# Altium project RK3566_.PrjPcb (part 6 of 6)
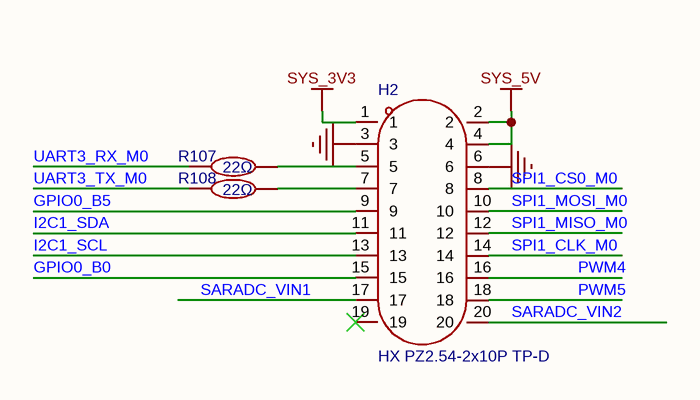
[diagram p13: 引出引脚_螺纹孔.schdoc]

## Nets that join several sheets
AVSS1_1: HDMI PHY _ IO1 (31 pins), LPDDR4X PHY_IO (119 pins), PMUIO _ VCCIO (24 pins), SD卡 PHY (8 pins), USB接口 PHY_IO (49 pins), WIFI_BT PHY (21 pins), 板载电源 (271 pins), 串口 PHY (D34.1 D35.1 H1.4), 扬声器_麦克风 (C191.2 C194.1 C195.1 R89.1), 以太网 PHY_以太网_WIFIBT IO (24 pins), 引出引脚_螺纹孔 (H2.3 H2.6)
LDO1: HDMI PHY _ IO1 (C3.1 C4.1 U1.1N13 U1.1N14), 板载电源 (C180.1 U8.23)
LDO2: PMUIO _ VCCIO (C76.2 C77.2 U1.1H5), USB接口 PHY_IO (6 pins), 板载电源 (C181.1 U8.21)
LDO3: PMUIO _ VCCIO (6 pins), 板载电源 (C182.1 U8.20)
LDO4: PMUIO _ VCCIO (C70.2 U1.1D13), 板载电源 (C183.1 U8.28), 扬声器_麦克风 (R88.2)
LDO5: PMUIO _ VCCIO (C71.2 U1.1F17), 板载电源 (C184.1 U8.29)
LDO6: PMUIO _ VCCIO (7 pins), 板载电源 (C185.1 R69.2 U8.31)
LDO7: PMUIO _ VCCIO (C82.2 C83.2 U1.1H4), USB接口 PHY_IO (6 pins), 板载电源 (C186.1 U8.3), 以太网 PHY_以太网_WIFIBT IO (C196.2 R90.1 U1.1D15 U1.1D16)
LDO8: LPDDR4X PHY_IO (16 pins), 板载电源 (C187.1 U8.5)
LDO9: HDMI PHY _ IO1 (C1.1 C2.1 U1.1P13), 板载电源 (C189.1 U8.6)
SWOUT1: HDMI PHY _ IO1 (Q2.1 Q3.1 R7.1 R9.1), USB接口 PHY_IO (C90.1 C99.1 U1.1H18 U1.1J2), WIFI_BT PHY (C118.2 C119.2 U6.22), 板载电源 (C188.1 R57.2 U8.55), 以太网 PHY_以太网_WIFIBT IO (11 pins)
SWOUT2: SD卡 PHY (CARD1.4), 板载电源 (C190.1 U8.58)
SYS0_5V: USB接口 PHY_IO (C101.2 R48.2 U4.7), 板载电源 (C134.2 C135.2 L5.1 R63.2)
SYS_3V3: HDMI PHY _ IO1 (R4.2), WIFI_BT PHY (C112.2 C113.2 U6.9), 板载电源 (19 pins), 串口 PHY (H1.1), 引出引脚_螺纹孔 (H2.1)
SYS_5V: HDMI PHY _ IO1 (D14.2 Q1.2), USB接口 PHY_IO (8 pins), 板载电源 (17 pins), 扬声器_麦克风 (C195.2 L15.2), 引出引脚_螺纹孔 (H2.2 H2.4)
VBUCK3: LPDDR4X PHY_IO (68 pins), 板载电源 (7 pins)
VCC_1V8: PMUIO _ VCCIO (C67.2 C73.2 U1.1C13 U1.1E16), 板载电源 (5 pins)
VDDQ: LPDDR4X PHY_IO (44 pins), 板载电源 (5 pins)
BT_HOST_WAKE: PMUIO _ VCCIO (U1.1B16 U1.1R16), WIFI_BT PHY (U6.7)
BT_REG_ON: PMUIO _ VCCIO (U1.1A17), WIFI_BT PHY (U6.34)
BT_WAKE: PMUIO _ VCCIO (U1.1A16), WIFI_BT PHY (U6.6)
CLK32K: WIFI_BT PHY (U6.24), 板载电源 (R57.1 R58.2)
GPIO0_B0: PMUIO _ VCCIO (U1.1T20), 引出引脚_螺纹孔 (H2.15)
GPIO0_B5: PMUIO _ VCCIO (U1.1U20), 引出引脚_螺纹孔 (H2.9)
HDMITX_CEC_M0: HDMI PHY _ IO1 (Q1.1 R4.1), 以太网 PHY_以太网_WIFIBT IO (U1.1V5)
HDMITX_SCL: HDMI PHY _ IO1 (Q2.2 R7.2), 以太网 PHY_以太网_WIFIBT IO (U1.AR12)
HDMITX_SDA: HDMI PHY _ IO1 (Q3.2 R9.2), 以太网 PHY_以太网_WIFIBT IO (U1.AP11)
I2C0_SCL: PMUIO _ VCCIO (U1.AJ37), 板载电源 (U8.1)
I2C0_SDA: PMUIO _ VCCIO (U1.AK38), 板载电源 (U8.2)
I2C1_SCL: PMUIO _ VCCIO (R23.2 U1.AK37), 引出引脚_螺纹孔 (H2.13)
I2C1_SDA: PMUIO _ VCCIO (R25.2 U1.AM38), 引出引脚_螺纹孔 (H2.11)
I2S1_LRCK_TX_M0: PMUIO _ VCCIO (R15.1), 板载电源 (U8.14)
I2S1_MCLK_M0: PMUIO _ VCCIO (R13.1), 板载电源 (U8.16)
I2S1_SCLK_TX_M0: PMUIO _ VCCIO (R14.1), 板载电源 (U8.15)
I2S1_SDI0_M0: PMUIO _ VCCIO (U1.1B14), 板载电源 (U8.18)
I2S1_SDO0_M0: PMUIO _ VCCIO (U1.B25), 板载电源 (U8.17)
MICIN: 板载电源 (U8.42), 扬声器_麦克风 (C193.1)
MICIP: 板载电源 (U8.43), 扬声器_麦克风 (C192.1)
PDM_CLK0_M0: PMUIO _ VCCIO (R16.1), 板载电源 (U8.19)
PMIC_INT: PMUIO _ VCCIO (U1.1R19), 板载电源 (U8.7)
PMIC_SLEEP: PMUIO _ VCCIO (U1.1P19), 板载电源 (U8.49)
PWM4: PMUIO _ VCCIO (U1.AN38), 引出引脚_螺纹孔 (H2.16)
PWM5: PMUIO _ VCCIO (U1.AM37), 引出引脚_螺纹孔 (H2.18)
RESETN: PMUIO _ VCCIO (C69.2 U1.1R20 U1.AG38), 板载电源 (5 pins)
SARADC_VIN1: 以太网 PHY_以太网_WIFIBT IO (U1.1C17), 引出引脚_螺纹孔 (H2.17)
SARADC_VIN2: 以太网 PHY_以太网_WIFIBT IO (U1.1B18), 引出引脚_螺纹孔 (H2.20)
SDMMC0_CLK: PMUIO _ VCCIO (R22.2), SD卡 PHY (CARD1.5 D18.2)
SDMMC0_CMD: PMUIO _ VCCIO (U1.1E19), SD卡 PHY (R30.1)
SDMMC0_D0: PMUIO _ VCCIO (U1.1E20), SD卡 PHY (R31.1)
SDMMC0_D1: PMUIO _ VCCIO (U1.1F19), SD卡 PHY (R32.1)
SDMMC0_D2: PMUIO _ VCCIO (U1.1D20), SD卡 PHY (R28.1)
SDMMC0_D3: PMUIO _ VCCIO (U1.1F18), SD卡 PHY (R29.1)
SDMMC0_DET: PMUIO _ VCCIO (U1.AF37), SD卡 PHY (R33.1)
SDMMC1_CLK: PMUIO _ VCCIO (R21.2), WIFI_BT PHY (U6.17)
SDMMC1_CMD: PMUIO _ VCCIO (U1.B35), WIFI_BT PHY (R53.1)
SDMMC1_D0: PMUIO _ VCCIO (U1.1C19), WIFI_BT PHY (R54.1)
SDMMC1_D1: PMUIO _ VCCIO (U1.1E18), WIFI_BT PHY (R55.1)
SDMMC1_D2: PMUIO _ VCCIO (U1.1D18), WIFI_BT PHY (R51.1)
SDMMC1_D3: PMUIO _ VCCIO (U1.1A20), WIFI_BT PHY (R52.1)
SPI1_CLK_M0: PMUIO _ VCCIO (R20.2), 引出引脚_螺纹孔 (H2.14)
SPI1_CS0_M0: PMUIO _ VCCIO (R17.2), 引出引脚_螺纹孔 (H2.8)
SPI1_MISO_M0: PMUIO _ VCCIO (R19.2), 引出引脚_螺纹孔 (H2.12)
SPI1_MOSI_M0: PMUIO _ VCCIO (R18.2), 引出引脚_螺纹孔 (H2.10)
SPKN_OUT: 板载电源 (U8.34), 扬声器_麦克风 (L14.1)
SPKP_OUT: 板载电源 (U8.32), 扬声器_麦克风 (L13.1)
UART0_RX: PMUIO _ VCCIO (U1.1T19), 串口 PHY (R86.1)
UART0_TX: PMUIO _ VCCIO (U1.1R18), 串口 PHY (R87.1)
UART1_CTSn_M1: WIFI_BT PHY (U6.41), 以太网 PHY_以太网_WIFIBT IO (U1.AB1)
UART1_RTSn_M1: WIFI_BT PHY (U6.44), 以太网 PHY_以太网_WIFIBT IO (U1.1L1)
UART1_RX_M1: WIFI_BT PHY (U6.42), 以太网 PHY_以太网_WIFIBT IO (U1.AL1)
UART1_TX_M1: WIFI_BT PHY (U6.43), 以太网 PHY_以太网_WIFIBT IO (U1.AL2)
UART3_RX_M0: PMUIO _ VCCIO (U1.A22), 引出引脚_螺纹孔 (R107.1)
UART3_TX_M0: PMUIO _ VCCIO (U1.B22), 引出引脚_螺纹孔 (R108.1)
VCC_SPK_HP: 板载电源 (U8.33), 扬声器_麦克风 (L15.1)
WL_HOST_WAKE: PMUIO _ VCCIO (U1.1R17), WIFI_BT PHY (U6.13)
WL_REG_ON: PMUIO _ VCCIO (U1.1A15), WIFI_BT PHY (U6.12)